# Altium schematic sheet Memory.SchDoc
size A4; SheetNumber: 7; SheetTotal: 8
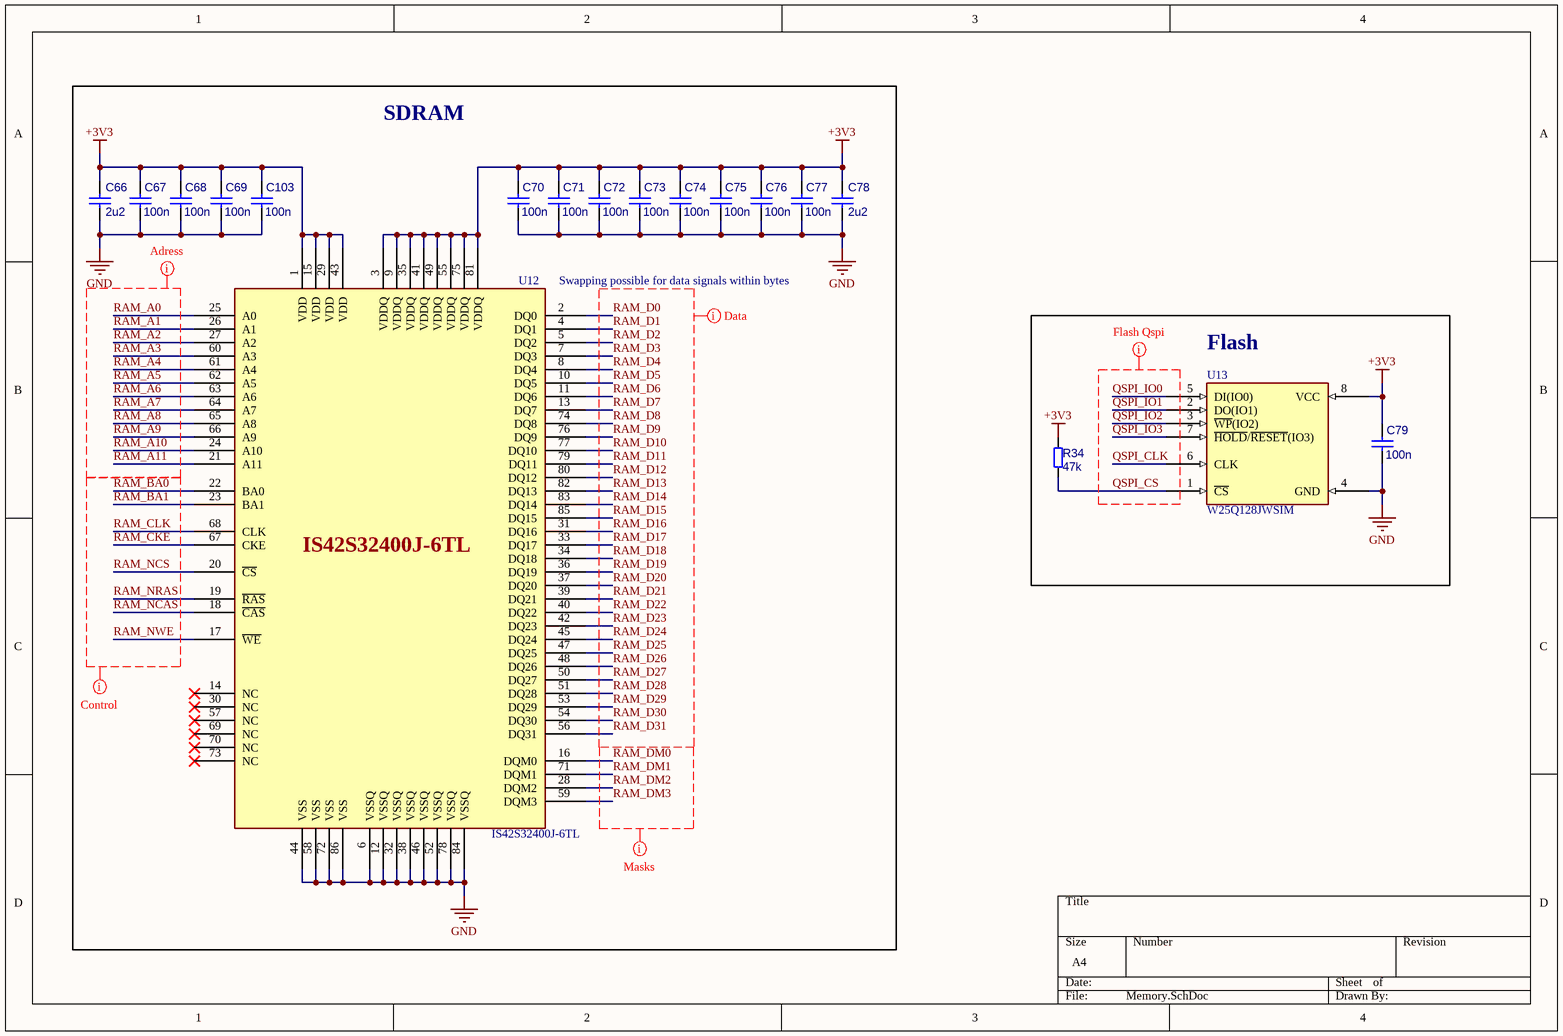
[diagram p0: Memory.SchDoc]

## Parts
C66  2u2  [C_0402]
C67  100n  [CAPC1005X50N_0402]
C68  100n  [CAPC1005X50N_0402]
C69  100n  [CAPC1005X50N_0402]
C70  100n  [CAPC1005X50N_0402]
C71  100n  [CAPC1005X50N_0402]
C72  100n  [CAPC1005X50N_0402]
C73  100n  [CAPC1005X50N_0402]
C74  100n  [CAPC1005X50N_0402]
C75  100n  [CAPC1005X50N_0402]
C76  100n  [CAPC1005X50N_0402]
C77  100n  [CAPC1005X50N_0402]
C78  2u2  [C_0402]
C79  100n  [CAPC1005X50N_0402]
C103  100n  [CAPC1005X50N_0402]
R34  47k  [R_0603]
U12  IS42S32400J-6TL  [TSOP-II-86_IS42S32400J-6TL]
U13  W25Q128JWSIM  [SOIC-8_W25Q128JWSIM]

## Blocks framed on the sheet
SDRAM: C66-C78 C103 U12
Flash: C79 R34 U13

## Nets
+3V3: C66.1 C67.1 C68.1 C69.1 C70.1 C71.1 C72.1 C73.1 C74.1 C75.1 C76.1 C77.1 C78.1 C79.1 C103.1 R34.2 U12.1(VDD) U12.3(VDDQ) U12.9(VDDQ) U12.15(VDD) U12.29(VDD) U12.35(VDDQ) U12.41(VDDQ) U12.43(VDD) U12.49(VDDQ) U12.55(VDDQ) U12.75(VDDQ) U12.81(VDDQ) U13.8(VCC)
GND: C66.2 C67.2 C68.2 C69.2 C70.2 C71.2 C72.2 C73.2 C74.2 C75.2 C76.2 C77.2 C78.2 C79.2 C103.2 U12.6(VSSQ) U12.12(VSSQ) U12.32(VSSQ) U12.38(VSSQ) U12.44(VSS) U12.46(VSSQ) U12.52(VSSQ) U12.58(VSS) U12.72(VSS) U12.78(VSSQ) U12.84(VSSQ) U12.86(VSS) U13.4(GND)
QSPI_CLK: U13.6(CLK)
QSPI_CS: R34.1 U13.1(~{CS})
QSPI_IO0: U13.5(DI(IO0))
QSPI_IO1: U13.2(DO(IO1))
QSPI_IO2: U13.3(~{WP}(IO2))
QSPI_IO3: U13.7(~{HOLD}/~{RESET}(IO3))
RAM_A0: U12.25(A0)
RAM_A1: U12.26(A1)
RAM_A2: U12.27(A2)
RAM_A3: U12.60(A3)
RAM_A4: U12.61(A4)
RAM_A5: U12.62(A5)
RAM_A6: U12.63(A6)
RAM_A7: U12.64(A7)
RAM_A8: U12.65(A8)
RAM_A9: U12.66(A9)
RAM_A10: U12.24(A10)
RAM_A11: U12.21(A11)
RAM_BA0: U12.22(BA0)
RAM_BA1: U12.23(BA1)
RAM_CKE: U12.67(CKE)
RAM_CLK: U12.68(CLK)
RAM_D0: U12.2(DQ0)
RAM_D1: U12.4(DQ1)
RAM_D2: U12.5(DQ2)
RAM_D3: U12.7(DQ3)
RAM_D4: U12.8(DQ4)
RAM_D5: U12.10(DQ5)
RAM_D6: U12.11(DQ6)
RAM_D7: U12.13(DQ7)
RAM_D8: U12.74(DQ8)
RAM_D9: U12.76(DQ9)
RAM_D10: U12.77(DQ10)
RAM_D11: U12.79(DQ11)
RAM_D12: U12.80(DQ12)
RAM_D13: U12.82(DQ13)
RAM_D14: U12.83(DQ14)
RAM_D15: U12.85(DQ15)
RAM_D16: U12.31(DQ16)
RAM_D17: U12.33(DQ17)
RAM_D18: U12.34(DQ18)
RAM_D19: U12.36(DQ19)
RAM_D20: U12.37(DQ20)
RAM_D21: U12.39(DQ21)
RAM_D22: U12.40(DQ22)
RAM_D23: U12.42(DQ23)
RAM_D24: U12.45(DQ24)
RAM_D25: U12.47(DQ25)
RAM_D26: U12.48(DQ26)
RAM_D27: U12.50(DQ27)
RAM_D28: U12.51(DQ28)
RAM_D29: U12.53(DQ29)
RAM_D30: U12.54(DQ30)
RAM_D31: U12.56(DQ31)
RAM_DM0: U12.16(DQM0)
RAM_DM1: U12.71(DQM1)
RAM_DM2: U12.28(DQM2)
RAM_DM3: U12.59(DQM3)
RAM_NCAS: U12.18(~{CAS})
RAM_NCS: U12.20(~{CS})
RAM_NRAS: U12.19(~{RAS})
RAM_NWE: U12.17(~{WE})

Not connected (* = marked no-connect by the designer): U12 14(NC)* 30(NC)* 57(NC)* 69(NC)* 70(NC)* 73(NC)*

## Layout directives
net class SDRAM_DATA: RAM_D0, RAM_D1, RAM_D2, RAM_D3, RAM_D4, RAM_D5, RAM_D6, RAM_D7, RAM_D8, RAM_D9, RAM_D10, RAM_D11, RAM_D12, RAM_D13, RAM_D14, RAM_D15, RAM_D16, RAM_D17, RAM_D18, RAM_D19, RAM_D20, RAM_D21, RAM_D22, RAM_D23, RAM_D24, RAM_D25, RAM_D26, RAM_D27, RAM_D28, RAM_D29, RAM_D30, RAM_D31
net class SDRAM_ADR: RAM_A0, RAM_A1, RAM_A2, RAM_A3, RAM_A4, RAM_A5, RAM_A6, RAM_A7, RAM_A8, RAM_A9, RAM_A10, RAM_A11
net class SDRAM_CTRL: RAM_BA0, RAM_BA1, RAM_CKE, RAM_CLK, RAM_NCAS, RAM_NCS, RAM_NRAS, RAM_NWE
net class SDRAM_MASK: RAM_DM0, RAM_DM1, RAM_DM2, RAM_DM3
net class QSPI: QSPI_CLK, QSPI_CS, QSPI_IO0, QSPI_IO1, QSPI_IO2, QSPI_IO3

## Notes on the sheet
- (near U12) Swapping possible for data signals within bytes

## Library data of the parts
C66 C78 = CMP-001-00085-2: Capacitor SMD Tantalum 0603 50V / Kyocera AVX F981C225MMA
C67-C77 C79 C103 = CMP-001-00084-2: MLCC 0402 50V / Samsung CL05B104KB54PNC
R34 = CMP-009-00177-7: Chip 0603
U12 = CMP-019-00064-5: 128M, 3.3V, Sdram, 4Mx32, 166Mhz, 86 Pin;; Min Supply Voltage: 3V; Number of Ports: 1; Access Time: 5.4ns; Max Supply Voltage: 3.6V; Length: 22.22mm; Nominal Supply Voltage (DC): 3.3V; Min Operating Temperature: 0°C; Country of Origin: Mainland China, Taiwan; China RoHS: Compliant; Width: 10.16mm; Lifecycle Status: Production; Harmonized Tariff Schedule (HTS) Code: 8542.32.00.02; Export Control Classification Number (ECCN) Code: EAR99; RoHS: Compliant; Number of Terminals: 86; Terminal Pitch: 500µm; Max Operating Temperature: 70°C; Temperature Grade: Commercial; REACH SVHC: Unaffected; Number of Circuits: 1; Height - Seated (Max): 1.2mm; Introduction Date: 2017-05-09
U13 = CMP-019-00065-3: NOR Flash Serial (SPI, Dual SPI, Quad SPI) 1.8V 128M-bit 16M x 8 8-Pin SOIC Bulk; Max Supply Voltage: 1.95V; Number of Circuits: 1; Max Supply Current: 20mA; Min Supply Voltage: 1.7V; Harmonized Tariff Schedule (HTS) Code: 8542.32.00.51; Min Operating Temperature: -40°C; RoHS: Compliant; Schedule B: 8542320070; Width: 5.28mm; Terminal Pitch: 1.27mm; REACH SVHC: Unaffected; China RoHS: Compliant; Export Control Classification Number (ECCN) Code: EAR99; Temperature Grade: Industrial; Country of Origin: Taiwan; Max Operating Temperature: 85°C; Number of Terminals: 8; Length: 5.28mm; Case/Package: SOP; Lifecycle Status: Production; Nominal Supply Voltage (DC): 1.8V; Memory Format: FLASH; Introduction Date: 2019-05-23; Height - Seated (Max): 2.16mm